# Altium schematic sheet 3.dw_3000.SchDoc
size A4; Organization: ORGANIZATION; Address1: ADDRESS 1; Address2: ADDRESS 2; Address3: ADDRESS 3; Address4: ADDRESS 4; DocumentNumber: 4; SheetNumber: 4; SheetTotal: 5; ENG_APP_DATE: --/--/--; DSN_APP_DATE: --/--/--; CHK_APP_DATE: --/--/--; Page: DWM3000
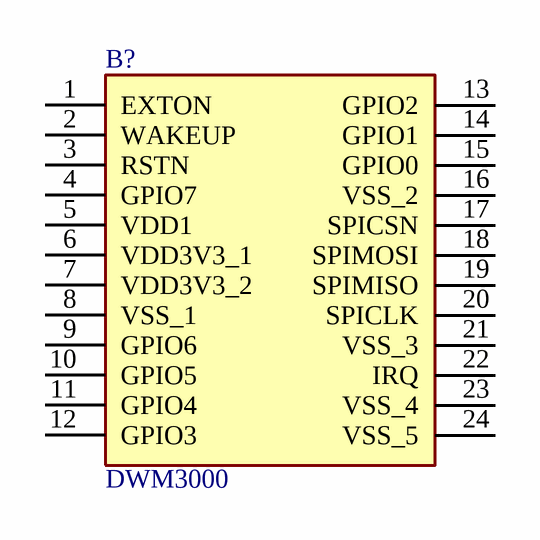
[diagram p0: 3.dw_3000.SchDoc]

## Parts
B?  DWM3000  [DWM3000]

## Nets

Not connected (* = marked no-connect by the designer): B? 1(EXTON) 2(WAKEUP) 3(RSTN) 4(GPIO7) 5(VDD1) 6(VDD3V3_1) 7(VDD3V3_2) 8(VSS_1) 9(GPIO6) 10(GPIO5) 11(GPIO4) 12(GPIO3) 13(GPIO2) 14(GPIO1) 15(GPIO0) 16(VSS_2) 17(SPICSN) 18(SPIMOSI) 19(SPIMISO) 20(SPICLK) 21(VSS_3) 22(IRQ) 23(VSS_4) 24(VSS_5)

## Notes on the sheet
- Title :
- Size:
- Date:
- Page :
- A4
- Number:
- Time:
- Revision:
- Sheet
- of
- Sheet Name :
- Drawn By :

## Library data of the parts
B? = DWM3000: 6.5 & 8.0 GHz Ultra-Wideband (UWB) Module,Supply voltage: 2.5 to 3.6 V (VDD3V3), 1.62 to 3.6 V (VDD1).; Manufacturer_Name: Qorvo; Geometry.Height: 2.89mm; Manufacturer_Part_Number: DWM3000; Mouser Part Number: N/A; Mouser Price/Stock: https://www.mouser.co.uk/ProductDetail/Qorvo/DWM3000?qs=iLbezkQI%252BsgcUwU6rIS9AQ%3D%3D; Arrow Part Number: *; Arrow Price/Stock: *; Datasheet Link: https://www.qorvo.com/products/p/DWM3000#documents